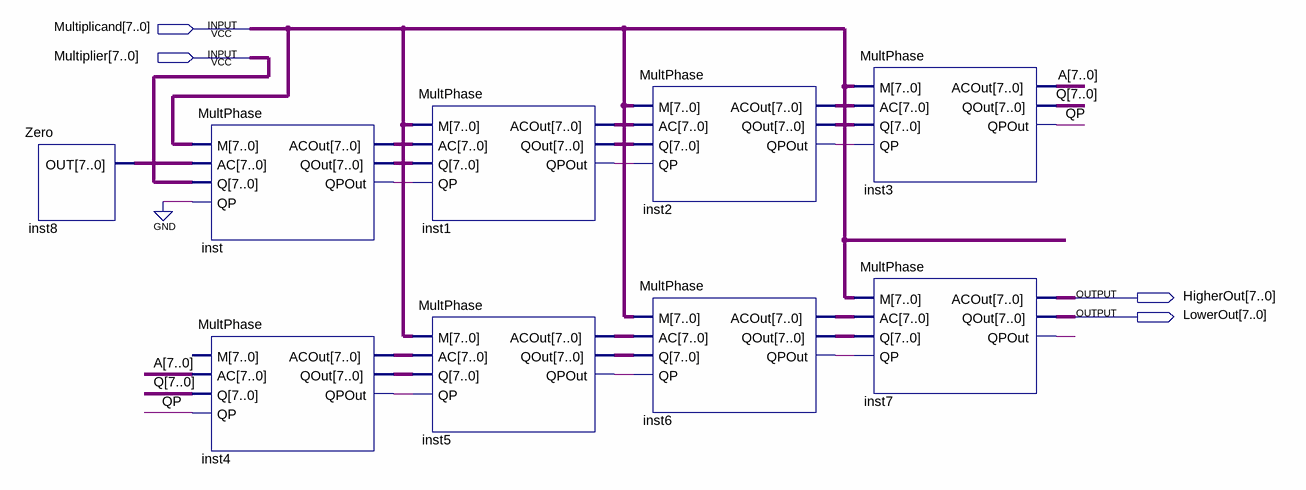
[diagram p0: schematic sheet]
// Quartus schematic MainMult.bdf as structural Verilog: 9 symbols, 4 pins
module MainMult (
  input  [7:0] Multiplicand,
  input  [7:0] Multiplier,
  output [7:0] HigherOut,
  output [7:0] LowerOut
);

  wire inst1_qpout, inst2_qpout, inst4_qpout, inst5_qpout, inst6_qpout, inst7_qpout, inst_qpout, QP;
  wire [7:0] A, inst1_acout, inst1_qout, inst2_acout, inst2_qout, inst4_acout, inst4_qout, inst5_acout,
       inst5_qout, inst6_acout, inst6_qout, inst8_out, inst_acout, inst_qout, Q;

  Zero inst8 (.OUT(inst8_out));
  MultPhase inst (
    .M(Multiplicand), .AC(inst8_out), .Q(Multiplier), .QP(1'b0), .ACOut(inst_acout), .QOut(inst_qout),
    .QPOut(inst_qpout));
  MultPhase inst4 (.AC(A), .Q(Q), .QP(QP), .ACOut(inst4_acout), .QOut(inst4_qout), .QPOut(inst4_qpout));  // open: M
  MultPhase inst1 (
    .M(Multiplicand), .AC(inst_acout), .Q(inst_qout), .QP(inst_qpout), .ACOut(inst1_acout),
    .QOut(inst1_qout), .QPOut(inst1_qpout));
  MultPhase inst5 (
    .M(Multiplicand), .AC(inst4_acout), .Q(inst4_qout), .QP(inst4_qpout), .ACOut(inst5_acout),
    .QOut(inst5_qout), .QPOut(inst5_qpout));
  MultPhase inst2 (
    .M(Multiplicand), .AC(inst1_acout), .Q(inst1_qout), .QP(inst1_qpout), .ACOut(inst2_acout),
    .QOut(inst2_qout), .QPOut(inst2_qpout));
  MultPhase inst6 (
    .M(Multiplicand), .AC(inst5_acout), .Q(inst5_qout), .QP(inst5_qpout), .ACOut(inst6_acout),
    .QOut(inst6_qout), .QPOut(inst6_qpout));
  MultPhase inst3 (
    .M(Multiplicand), .AC(inst2_acout), .Q(inst2_qout), .QP(inst2_qpout), .ACOut(A), .QOut(Q), .QPOut(QP));
  MultPhase inst7 (
    .M(Multiplicand), .AC(inst6_acout), .Q(inst6_qout), .QP(inst6_qpout), .ACOut(HigherOut), .QOut(LowerOut),
    .QPOut(inst7_qpout));
endmodule
